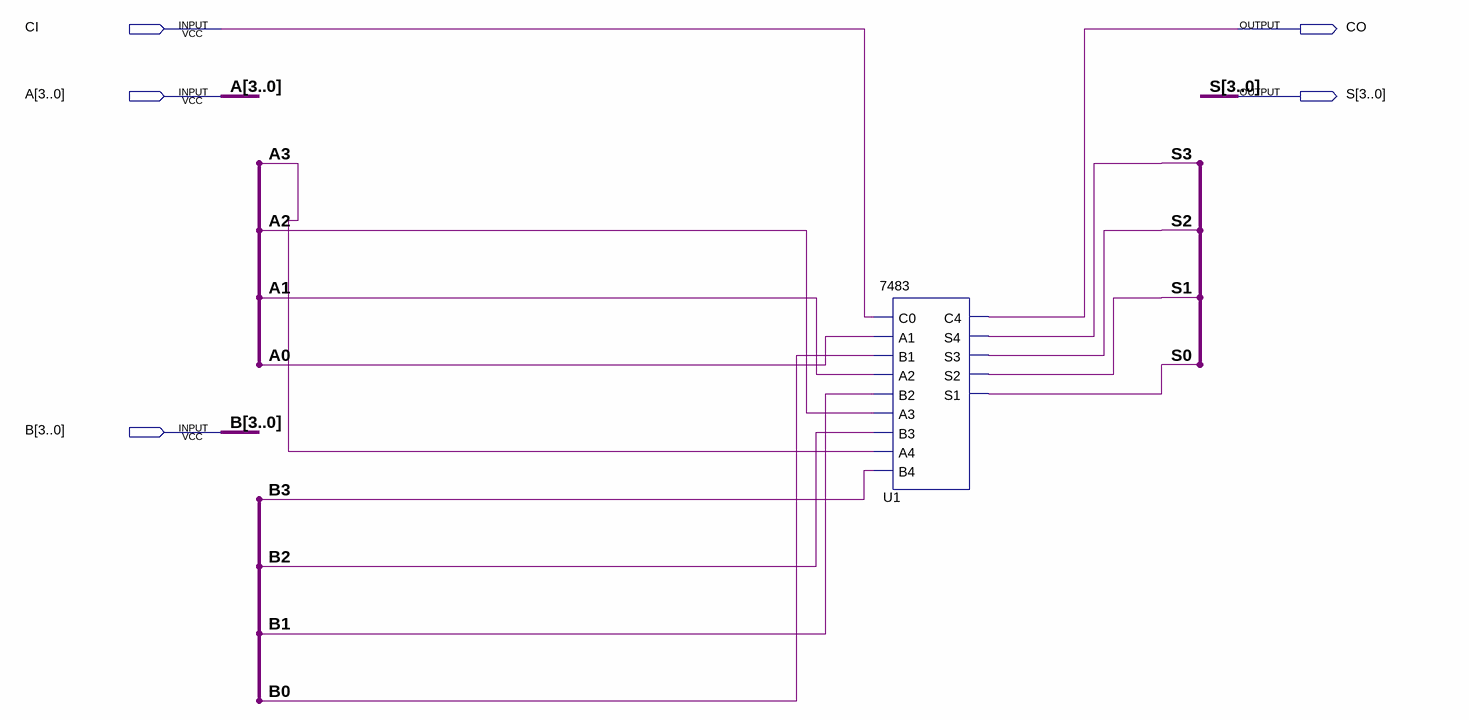
[diagram p0: schematic sheet]
// Quartus schematic add4.bdf as structural Verilog: 1 symbols, 5 pins
module add4 (
  input  CI,
  input  [3:0] A,
  input  [3:0] B,
  output CO,
  output [3:0] S
);

  \7483  U1 (
    .C0(CI), .A1(A[0]), .B1(B[0]), .A2(A[1]), .B2(B[1]), .A3(A[2]), .B3(B[2]), .A4(A[3]), .B4(B[3]), .C4(CO),
    .S4(S[3]), .S3(S[2]), .S2(S[1]), .S1(S[0]));
endmodule
